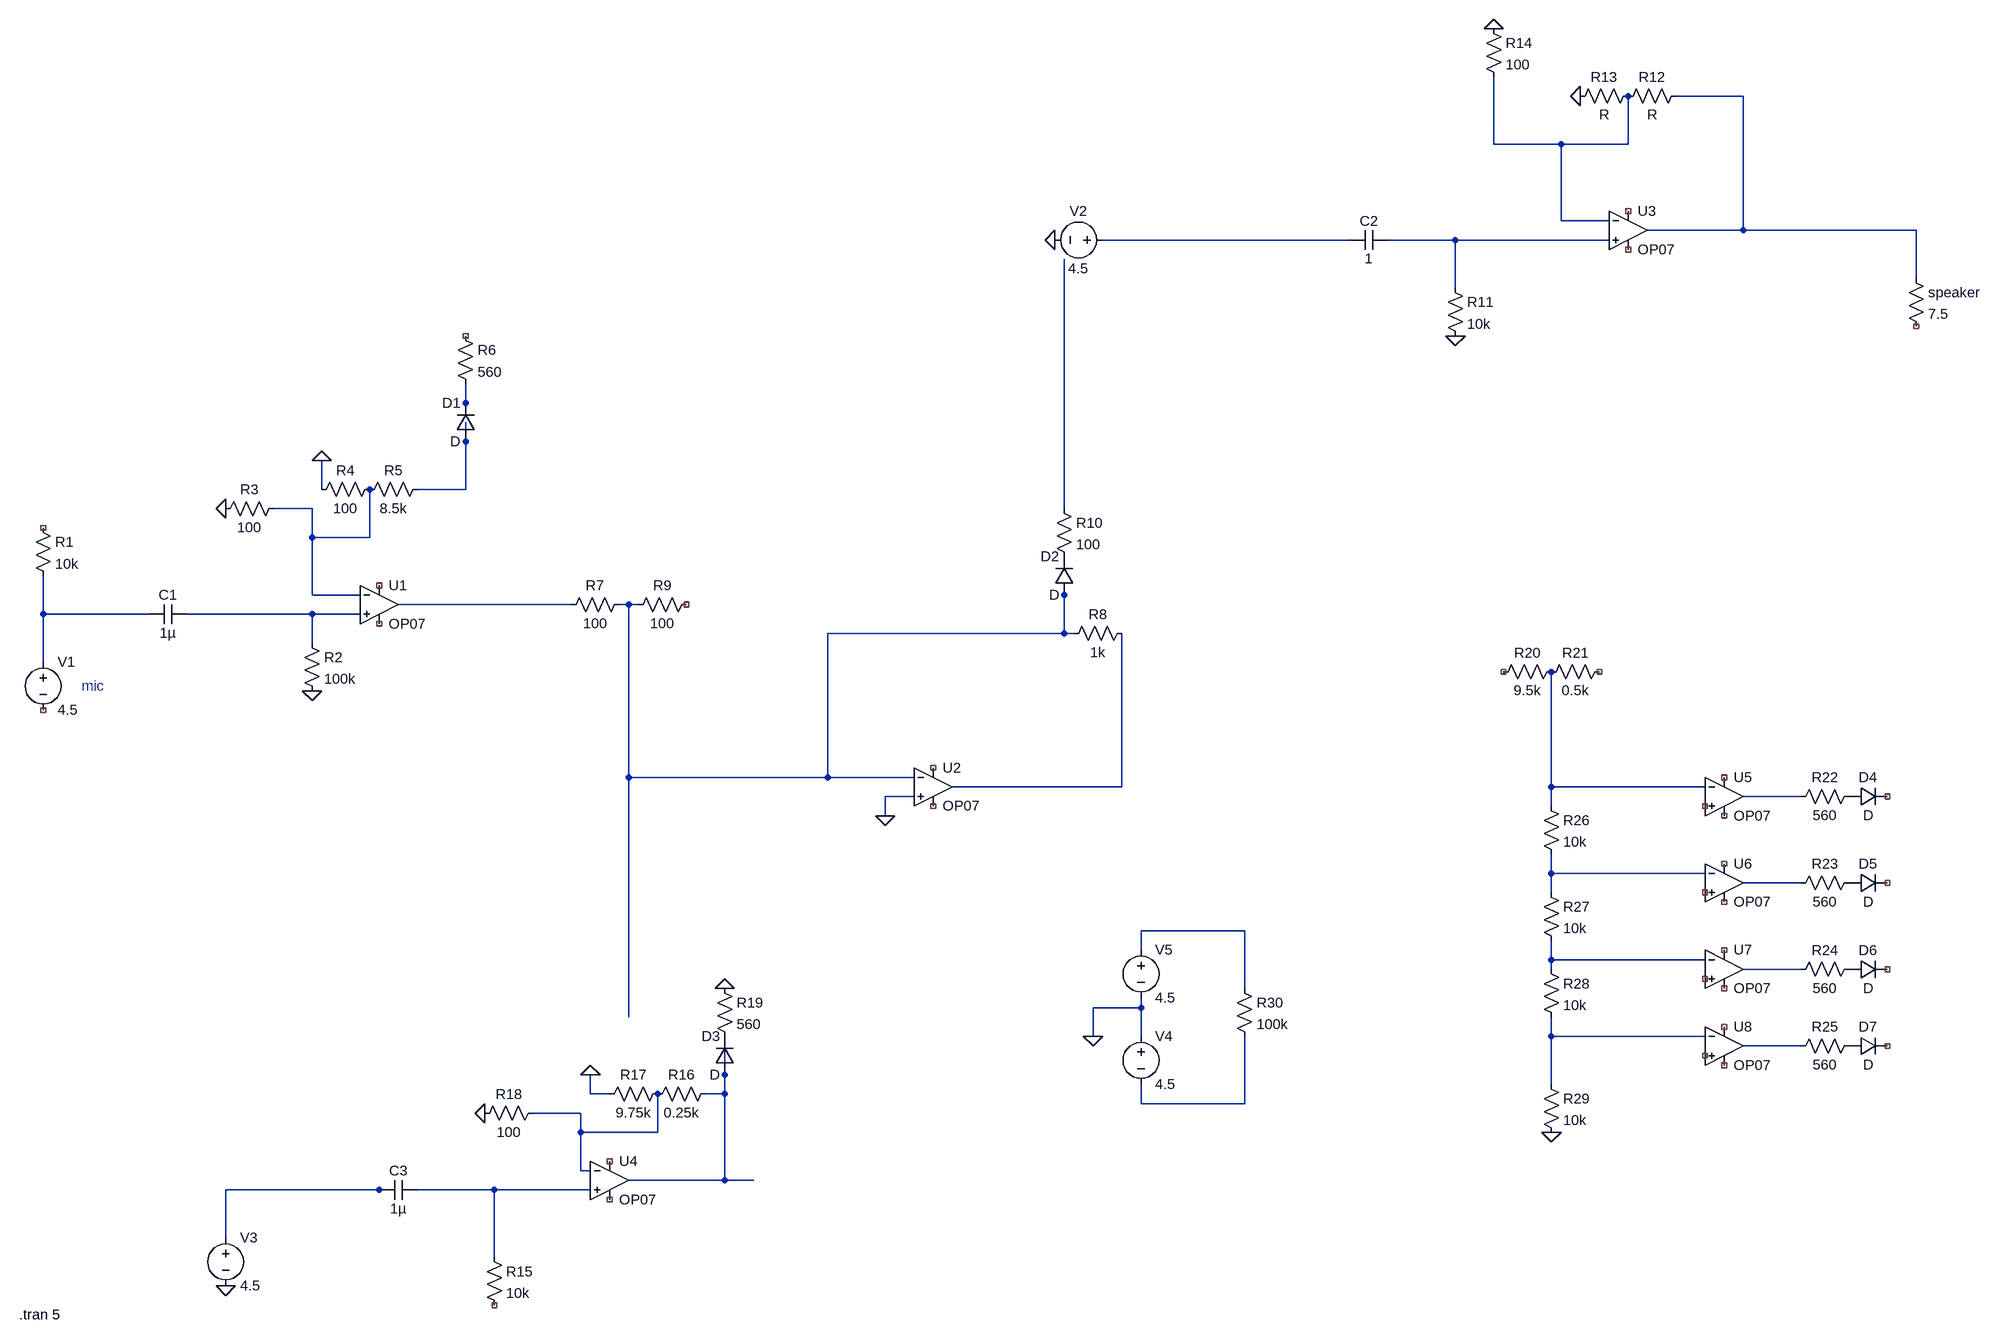
[diagram p0: schematic Draft2.asc]
Draft2.asc, the LTspice schematic file:
Version 4.1
SHEET 1 3492 1216
WIRE 3088 -832 2976 -832
WIRE 2672 -752 2672 -864
WIRE 2784 -752 2672 -752
WIRE 2896 -752 2896 -832
WIRE 2896 -752 2784 -752
WIRE 2784 -624 2784 -752
WIRE 2864 -624 2784 -624
WIRE 3088 -608 3088 -832
WIRE 3088 -608 2928 -608
WIRE 3376 -608 3088 -608
WIRE 2432 -592 1920 -592
WIRE 2608 -592 2496 -592
WIRE 2864 -592 2608 -592
WIRE 3376 -528 3376 -608
WIRE 2608 -512 2608 -592
WIRE 800 -320 800 -352
WIRE 800 -304 800 -320
WIRE 800 -256 800 -288
WIRE 560 -176 560 -224
WIRE 800 -176 800 -256
WIRE 800 -176 720 -176
WIRE 544 -144 480 -144
WIRE 1856 -144 1856 -560
WIRE 544 -96 544 -144
WIRE 640 -96 640 -176
WIRE 640 -96 544 -96
WIRE 544 0 544 -96
WIRE 624 0 544 0
WIRE 1856 0 1856 -16
WIRE 976 16 688 16
WIRE 1072 16 1056 16
WIRE 1088 16 1072 16
WIRE 96 32 96 -32
WIRE 272 32 96 32
WIRE 544 32 336 32
WIRE 624 32 544 32
WIRE 1856 64 1856 0
WIRE 1856 64 1440 64
WIRE 1872 64 1856 64
WIRE 544 80 544 32
WIRE 96 112 96 32
WIRE 1072 304 1072 16
WIRE 1440 304 1440 64
WIRE 1440 304 1072 304
WIRE 1584 304 1440 304
WIRE 1952 320 1952 64
WIRE 1952 320 1648 320
WIRE 2768 320 2768 128
WIRE 3024 320 2768 320
WIRE 1584 336 1536 336
WIRE 3184 336 3088 336
WIRE 2768 352 2768 320
WIRE 1536 368 1536 336
WIRE 2768 464 2768 432
WIRE 3024 464 2768 464
WIRE 3184 480 3088 480
WIRE 2768 496 2768 464
WIRE 2160 560 1984 560
WIRE 1984 592 1984 560
WIRE 2768 608 2768 576
WIRE 3024 608 2768 608
WIRE 2768 624 2768 608
WIRE 3184 624 3088 624
WIRE 2160 656 2160 560
WIRE 1984 688 1984 672
WIRE 1984 688 1904 688
WIRE 1072 704 1072 304
WIRE 1904 736 1904 688
WIRE 1984 736 1984 688
WIRE 2768 736 2768 704
WIRE 3024 736 2768 736
WIRE 3184 752 3088 752
WIRE 1232 800 1232 752
WIRE 2768 816 2768 736
WIRE 1008 832 1008 800
WIRE 1040 832 1008 832
WIRE 1232 832 1232 800
WIRE 1232 832 1200 832
WIRE 1984 848 1984 816
WIRE 2160 848 2160 736
WIRE 2160 848 1984 848
WIRE 992 864 912 864
WIRE 992 896 992 864
WIRE 1120 896 1120 832
WIRE 1120 896 992 896
WIRE 992 960 992 896
WIRE 1008 960 992 960
WIRE 1232 976 1232 832
WIRE 1232 976 1072 976
WIRE 1280 976 1232 976
WIRE 656 992 400 992
WIRE 672 992 656 992
WIRE 848 992 720 992
WIRE 1008 992 848 992
WIRE 400 1072 400 992
WIRE 848 1104 848 992
FLAG 400 -144 0
FLAG 560 -224 0
FLAG 544 160 0
FLAG 1536 368 0
FLAG 1840 -592 0
FLAG 2608 -432 0
FLAG 2672 -944 0
FLAG 2816 -832 0
FLAG 400 1152 0
FLAG 1008 800 0
FLAG 832 864 0
FLAG 1232 656 0
FLAG 2768 896 0
FLAG 1904 736 0
SYMBOL voltage 96 96 R0
WINDOW 123 0 0 Left 0
WINDOW 39 0 0 Left 0
SYMATTR InstName V1
SYMATTR Value 4.5
SYMBOL res 80 -128 R0
SYMATTR InstName R1
SYMATTR Value 10k
SYMBOL cap 336 16 R90
WINDOW 0 0 32 VBottom 2
WINDOW 3 32 32 VTop 2
SYMATTR InstName C1
SYMATTR Value 1µ
SYMBOL res 528 64 R0
SYMATTR InstName R2
SYMATTR Value 100k
SYMBOL OpAmps\\OP07 656 -48 R0
SYMATTR InstName U1
SYMBOL res 496 -160 R90
WINDOW 0 0 56 VBottom 2
WINDOW 3 32 56 VTop 2
SYMATTR InstName R3
SYMATTR Value 100
SYMBOL res 656 -192 R90
WINDOW 0 0 56 VBottom 2
WINDOW 3 32 56 VTop 2
SYMATTR InstName R4
SYMATTR Value 100
SYMBOL res 736 -192 R90
WINDOW 0 0 56 VBottom 2
WINDOW 3 32 56 VTop 2
SYMATTR InstName R5
SYMATTR Value 8.5k
SYMBOL res 784 -448 R0
SYMATTR InstName R6
SYMATTR Value 560
SYMBOL diode 816 -256 R180
WINDOW 0 24 64 Left 2
WINDOW 3 24 0 Left 2
SYMATTR InstName D1
SYMBOL res 1072 0 R90
WINDOW 0 0 56 VBottom 2
WINDOW 3 32 56 VTop 2
SYMATTR InstName R7
SYMATTR Value 100
SYMBOL res 1184 0 R90
WINDOW 0 0 56 VBottom 2
WINDOW 3 32 56 VTop 2
SYMATTR InstName R9
SYMATTR Value 100
SYMBOL OpAmps\\OP07 1616 256 R0
SYMATTR InstName U2
SYMBOL res 1968 48 R90
WINDOW 0 0 56 VBottom 2
WINDOW 3 32 56 VTop 2
SYMATTR InstName R8
SYMATTR Value 1k
SYMBOL diode 1872 0 R180
WINDOW 0 24 64 Left 2
WINDOW 3 24 0 Left 2
SYMATTR InstName D2
SYMBOL res 1840 -160 R0
SYMATTR InstName R10
SYMATTR Value 100
SYMBOL voltage 1936 -592 R90
WINDOW 0 -32 56 VBottom 2
WINDOW 3 32 56 VTop 2
WINDOW 123 0 0 Left 0
WINDOW 39 0 0 Left 0
SYMATTR InstName V2
SYMATTR Value 4.5
SYMBOL cap 2496 -608 R90
WINDOW 0 0 32 VBottom 2
WINDOW 3 32 32 VTop 2
SYMATTR InstName C2
SYMATTR Value 1
SYMBOL res 2592 -528 R0
SYMATTR InstName R11
SYMATTR Value 10k
SYMBOL OpAmps\\OP07 2896 -672 R0
SYMATTR InstName U3
SYMBOL res 3360 -544 R0
SYMATTR InstName speaker
SYMATTR Value 7.5
SYMBOL res 2992 -848 R90
WINDOW 0 0 56 VBottom 2
WINDOW 3 32 56 VTop 2
SYMATTR InstName R12
SYMBOL res 2912 -848 R90
WINDOW 0 0 56 VBottom 2
WINDOW 3 32 56 VTop 2
SYMATTR InstName R13
SYMBOL res 2656 -960 R0
SYMATTR InstName R14
SYMATTR Value 100
SYMBOL voltage 400 1056 R0
WINDOW 123 0 0 Left 0
WINDOW 39 0 0 Left 0
SYMATTR InstName V3
SYMATTR Value 4.5
SYMBOL cap 720 976 R90
WINDOW 0 0 32 VBottom 2
WINDOW 3 32 32 VTop 2
SYMATTR InstName C3
SYMATTR Value 1µ
SYMBOL res 832 1088 R0
SYMATTR InstName R15
SYMATTR Value 10k
SYMBOL OpAmps\\OP07 1040 912 R0
SYMATTR InstName U4
SYMBOL res 1216 816 R90
WINDOW 0 0 56 VBottom 2
WINDOW 3 32 56 VTop 2
SYMATTR InstName R16
SYMATTR Value 0.25k
SYMBOL res 1136 816 R90
WINDOW 0 0 56 VBottom 2
WINDOW 3 32 56 VTop 2
SYMATTR InstName R17
SYMATTR Value 9.75k
SYMBOL res 928 848 R90
WINDOW 0 0 56 VBottom 2
WINDOW 3 32 56 VTop 2
SYMATTR InstName R18
SYMATTR Value 100
SYMBOL diode 1248 800 R180
WINDOW 0 24 64 Left 2
WINDOW 3 24 0 Left 2
SYMATTR InstName D3
SYMBOL res 1216 640 R0
SYMATTR InstName R19
SYMATTR Value 560
SYMBOL res 2784 112 R90
WINDOW 0 0 56 VBottom 2
WINDOW 3 32 56 VTop 2
SYMATTR InstName R20
SYMATTR Value 9.5k
SYMBOL res 2864 112 R90
WINDOW 0 0 56 VBottom 2
WINDOW 3 32 56 VTop 2
SYMATTR InstName R21
SYMATTR Value 0.5k
SYMBOL OpAmps\\OP07 3056 272 R0
SYMATTR InstName U5
SYMBOL res 3280 320 R90
WINDOW 0 0 56 VBottom 2
WINDOW 3 32 56 VTop 2
SYMATTR InstName R22
SYMATTR Value 560
SYMBOL diode 3264 352 R270
WINDOW 0 32 32 VTop 2
WINDOW 3 0 32 VBottom 2
SYMATTR InstName D4
SYMBOL OpAmps\\OP07 3056 416 R0
SYMATTR InstName U6
SYMBOL res 3280 464 R90
WINDOW 0 0 56 VBottom 2
WINDOW 3 32 56 VTop 2
SYMATTR InstName R23
SYMATTR Value 560
SYMBOL diode 3264 496 R270
WINDOW 0 32 32 VTop 2
WINDOW 3 0 32 VBottom 2
SYMATTR InstName D5
SYMBOL OpAmps\\OP07 3056 560 R0
SYMATTR InstName U7
SYMBOL res 3280 608 R90
WINDOW 0 0 56 VBottom 2
WINDOW 3 32 56 VTop 2
SYMATTR InstName R24
SYMATTR Value 560
SYMBOL diode 3264 640 R270
WINDOW 0 32 32 VTop 2
WINDOW 3 0 32 VBottom 2
SYMATTR InstName D6
SYMBOL OpAmps\\OP07 3056 688 R0
SYMATTR InstName U8
SYMBOL res 3280 736 R90
WINDOW 0 0 56 VBottom 2
WINDOW 3 32 56 VTop 2
SYMATTR InstName R25
SYMATTR Value 560
SYMBOL diode 3264 768 R270
WINDOW 0 32 32 VTop 2
WINDOW 3 0 32 VBottom 2
SYMATTR InstName D7
SYMBOL res 2752 336 R0
SYMATTR InstName R26
SYMATTR Value 10k
SYMBOL res 2752 480 R0
SYMATTR InstName R27
SYMATTR Value 10k
SYMBOL res 2752 608 R0
SYMATTR InstName R28
SYMATTR Value 10k
SYMBOL res 2752 800 R0
SYMATTR InstName R29
SYMATTR Value 10k
SYMBOL voltage 1984 720 R0
WINDOW 123 0 0 Left 0
WINDOW 39 0 0 Left 0
SYMATTR InstName V4
SYMATTR Value 4.5
SYMBOL voltage 1984 576 R0
WINDOW 123 0 0 Left 0
WINDOW 39 0 0 Left 0
SYMATTR InstName V5
SYMATTR Value 4.5
SYMBOL res 2144 640 R0
SYMATTR InstName R30
SYMATTR Value 100k
TEXT 160 152 Left 2 ;mic
TEXT 56 1200 Left 2 !.tran 5

The netlist it stands for:
* Draft2.asc
V1 N011 NC_01 4.5
R1 NC_02 N011 10k
C1 N012 N011 1µ
R2 N012 0 100k
X§U1 N012 N007 NC_03 NC_04 N010 LT1001  ; OP07, pins In+ In- V+ V- OUT
R3 N007 0 100
R4 N007 0 100
R5 N006 N007 8.5k
R6 NC_05 N005 560
D1 N006 N005 D
R7 N009 N010 100
R9 NC_06 N009 100
X§U2 0 N009 NC_07 NC_08 N013 LT1001  ; OP07, pins In+ In- V+ V- OUT
R8 N013 N009 1k
D2 N009 P001 D
R10 N008 P001 100
V2 N003 0 4.5
C2 N004 N003 1
R11 N004 0 10k
X§U3 N004 N002 NC_09 NC_10 N001 LT1001  ; OP07, pins In+ In- V+ V- OUT
R§speaker N001 NC_11 7.5
R12 N001 N002 R
R13 N002 0 R
R14 0 N002 100
V3 N026 0 4.5
C3 N027 N026 1µ
R15 N027 NC_12 10k
X§U4 N027 N025 NC_13 NC_14 N023 LT1001  ; OP07, pins In+ In- V+ V- OUT
R16 N023 N025 0.25k
R17 N025 0 9.75k
R18 N025 0 100
D3 N023 P002 D
R19 0 P002 560
R20 N014 NC_15 9.5k
R21 NC_16 N014 0.5k
X§U5 NC_17 N014 NC_18 NC_19 N015 LT1001  ; OP07, pins In+ In- V+ V- OUT
R22 P003 N015 560
D4 P003 NC_20 D
X§U6 NC_21 N016 NC_22 NC_23 N017 LT1001  ; OP07, pins In+ In- V+ V- OUT
R23 P004 N017 560
D5 P004 NC_24 D
X§U7 NC_25 N019 NC_26 NC_27 N020 LT1001  ; OP07, pins In+ In- V+ V- OUT
R24 P005 N020 560
D6 P005 NC_28 D
X§U8 NC_29 N021 NC_30 NC_31 N022 LT1001  ; OP07, pins In+ In- V+ V- OUT
R25 P006 N022 560
D7 P006 NC_32 D
R26 N014 N016 10k
R27 N016 N019 10k
R28 N019 N021 10k
R29 N021 0 10k
V4 0 N024 4.5
V5 N018 0 4.5
R30 N018 N024 100k
.model D D
.lib standard.dio
* mic
.tran 5
.lib LTC.lib
.backanno
.end